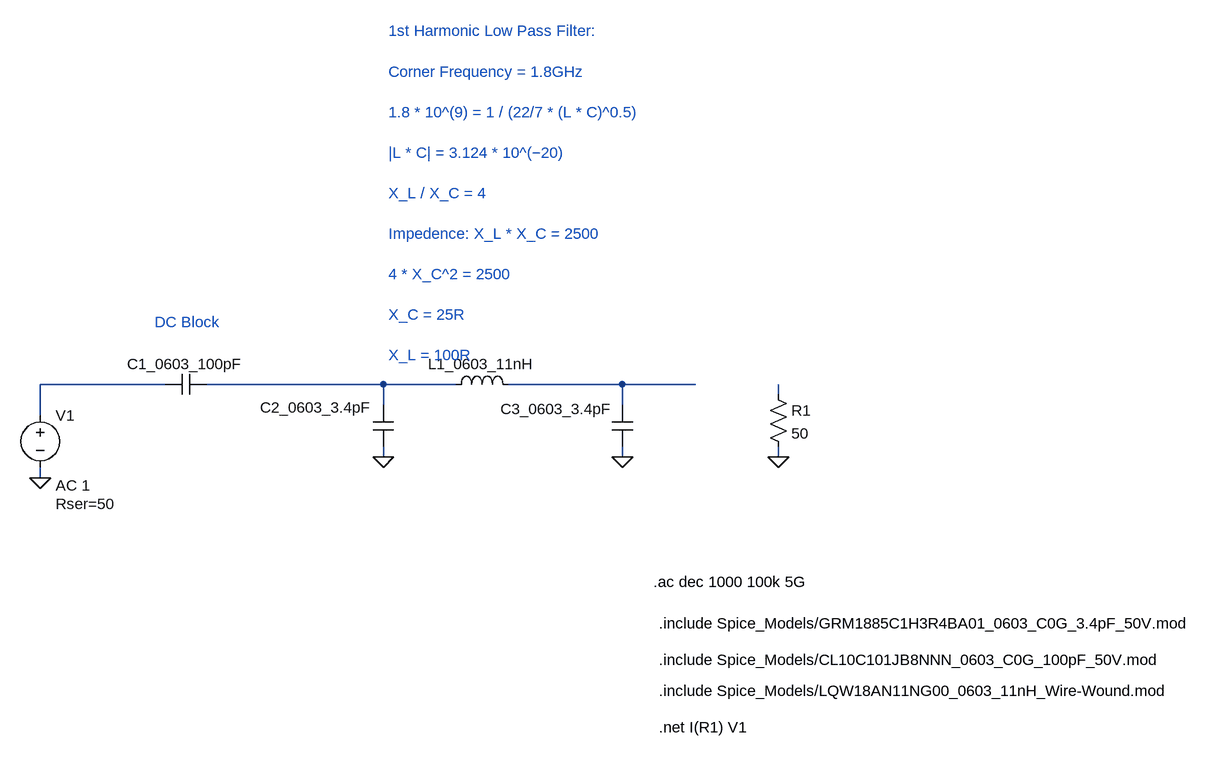
[diagram p0: schematic 1st_Harmonic_Low_Pass_Pi-Filter_Real.asc]
1st_Harmonic_Low_Pass_Pi-Filter_Real.asc, the LTspice schematic file:
Version 4.1
SHEET 1 1676 680
WIRE 32 64 -160 64
WIRE 368 64 96 64
WIRE 480 64 368 64
WIRE 736 64 560 64
WIRE 848 64 736 64
WIRE 976 80 976 64
WIRE 368 96 368 64
WIRE 736 96 736 64
WIRE -160 112 -160 64
WIRE 368 176 368 160
WIRE 736 176 736 160
WIRE 976 176 976 160
WIRE -160 208 -160 192
FLAG 736 176 0
FLAG -160 208 0
FLAG 976 176 0
FLAG 368 176 0
SYMBOL voltage -160 96 R0
WINDOW 123 24 124 Left 2
WINDOW 39 24 152 Left 2
SYMATTR Value2 AC 1
SYMATTR SpiceLine Rser=50
SYMATTR InstName V1
SYMATTR Value ""
SYMBOL ind 464 80 R270
WINDOW 0 32 56 VTop 2
WINDOW 3 5 56 Invisible 2
SYMATTR InstName L1_0603_11nH
SYMATTR Value LQW18AN11NG00
SYMATTR Prefix X
SYMBOL cap 720 96 R0
WINDOW 0 -172 6 Left 2
WINDOW 3 24 56 Invisible 2
SYMATTR InstName C3_0603_3.4pF
SYMATTR Value GRM1885C1H3R4BA01_DC0V_25degC
SYMATTR Prefix X
SYMBOL res 960 64 R0
SYMATTR InstName R1
SYMATTR Value 50
SYMBOL cap 352 96 R0
WINDOW 0 -174 4 Left 2
WINDOW 3 24 56 Invisible 2
SYMATTR InstName C2_0603_3.4pF
SYMATTR Value GRM1885C1H3R4BA01_DC0V_25degC
SYMATTR Prefix X
SYMBOL cap 96 48 R90
WINDOW 0 0 32 VBottom 2
WINDOW 3 32 32 Invisible 2
SYMATTR InstName C1_0603_100pF
SYMATTR Value CL10C101JB8NNN_Precise_DC0V_25degC
SYMATTR Prefix X
TEXT 784 368 Left 2 !.ac dec 1000 100k 5G
TEXT 792 432 Left 2 !.include Spice_Models/GRM1885C1H3R4BA01_0603_C0G_3.4pF_50V.mod
TEXT 792 488 Left 2 !.include Spice_Models/CL10C101JB8NNN_0603_C0G_100pF_50V.mod
TEXT 792 536 Left 2 !.include Spice_Models/LQW18AN11NG00_0603_11nH_Wire-Wound.mod
TEXT 792 592 Left 2 !.net I(R1) V1
TEXT 376 -480 Left 2 ;1st Harmonic Low Pass Filter:\n \nCorner Frequency = 1.8GHz\n \n1.8 * 10^(9) = 1 / (22/7 * (L * C)^0.5)\n \n|L * C| = 3.124 * 10^(−20)\n \nX_L / X_C = 4\n \nImpedence: X_L * X_C = 2500\n \n4 * X_C^2 = 2500\n \nX_C = 25R\n \nX_L = 100R
TEXT 16 -32 Left 2 ;DC Block

The netlist it stands for:
* 1st_Harmonic_Low_Pass_Pi-Filter_Real.asc
V1 N001 0 AC 1 Rser=50
X§L1_0603_11nH N002 N003 LQW18AN11NG00  ; pins A B
X§C3_0603_3.4pF N003 0 GRM1885C1H3R4BA01_DC0V_25degC  ; pins A B
R1 N004 0 50
X§C2_0603_3.4pF N002 0 GRM1885C1H3R4BA01_DC0V_25degC  ; pins A B
X§C1_0603_100pF N002 N001 CL10C101JB8NNN_Precise_DC0V_25degC  ; pins A B
.ac dec 1000 100k 5G
.include Spice_Models/GRM1885C1H3R4BA01_0603_C0G_3.4pF_50V.mod
.include Spice_Models/CL10C101JB8NNN_0603_C0G_100pF_50V.mod
.include Spice_Models/LQW18AN11NG00_0603_11nH_Wire-Wound.mod
.net I(R1) V1
* 1st Harmonic Low Pass Filter:
* Corner Frequency = 1.8GHz
* 1.8 * 10^(9) = 1 / (22/7 * (L * C)^0.5)
* |L * C| = 3.124 * 10^(−20)
* X_L / X_C = 4
* Impedence: X_L * X_C = 2500
* 4 * X_C^2 = 2500
* X_C = 25R
* X_L = 100R
* DC Block
.backanno
.end